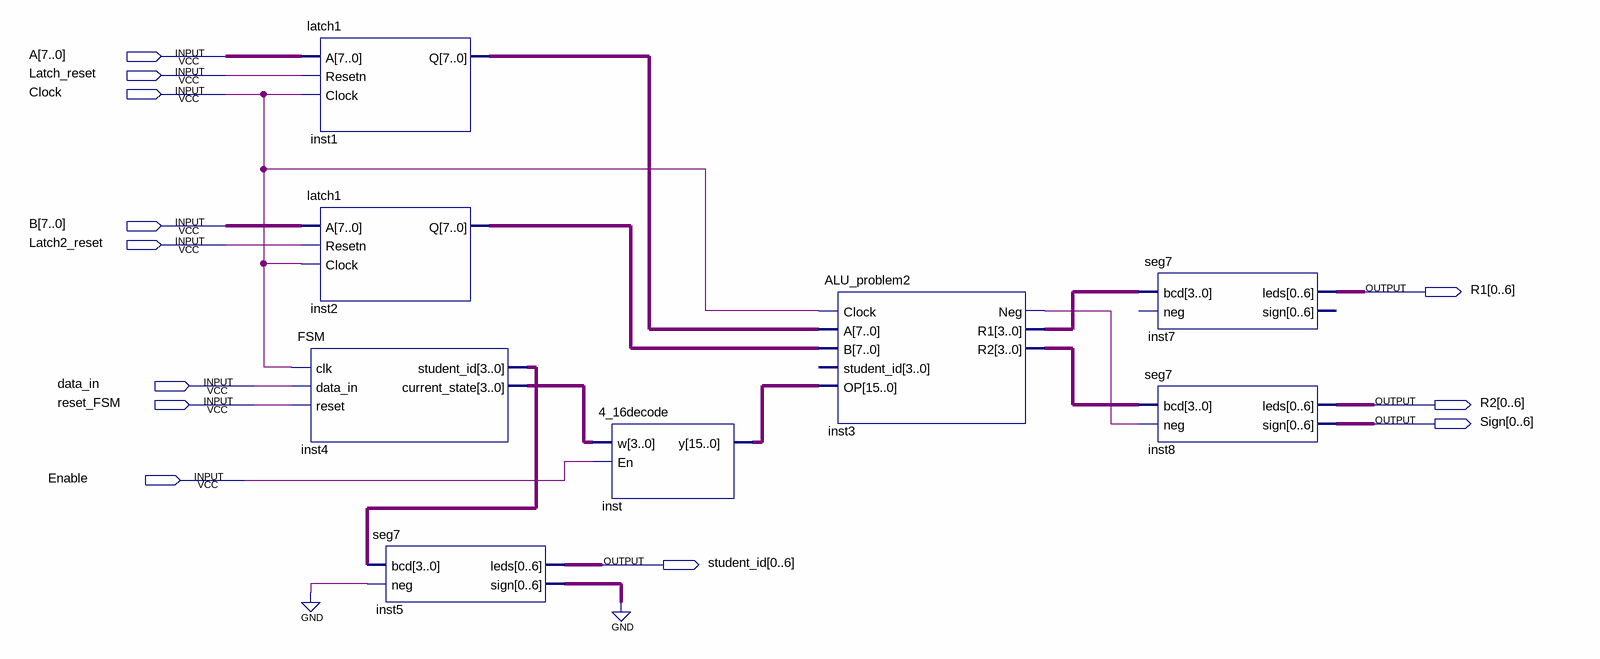
[diagram p0: schematic sheet]
// Quartus schematic problem2.bdf as structural Verilog: 8 symbols, 12 pins
module problem2 (
  input  [7:0] A,
  input  Latch_reset,
  input  Clock,
  input  [7:0] B,
  input  Latch2_reset,
  input  data_in,
  input  reset_FSM,
  input  Enable,
  output [0:6] R1,
  output [0:6] R2,
  output [0:6] Sign,
  output [0:6] student_id
);

  wire inst3_neg;
  wire [3:0] inst3_r1, inst3_r2, inst4_current_state, inst4_student_id;
  wire [6:0] inst5_sign;
  wire [7:0] inst1_q, inst2_q;
  wire [15:0] inst_y;

  latch1 inst1 (.A(A), .Resetn(Latch_reset), .Clock(Clock), .Q(inst1_q));
  latch1 inst2 (.A(B), .Resetn(Latch2_reset), .Clock(Clock), .Q(inst2_q));
  FSM inst4 (
    .clk(Clock), .data_in(data_in), .reset(reset_FSM), .student_id(inst4_student_id),
    .current_state(inst4_current_state));
  seg7 inst5 (.bcd(inst4_student_id), .neg(1'b0), .leds(student_id), .sign(inst5_sign));
  \4_16decode  inst (.w(inst4_current_state), .En(Enable), .y(inst_y));
  ALU_problem2 inst3 (
    .Clock(Clock), .A(inst1_q), .B(inst2_q), .OP(inst_y), .Neg(inst3_neg), .R1(inst3_r1), .R2(inst3_r2));  // open: student_id
  seg7 inst7 (.bcd(inst3_r1), .leds(R1));  // open: neg, sign
  seg7 inst8 (.bcd(inst3_r2), .neg(inst3_neg), .leds(R2), .sign(Sign));
  // also tied to GND on the sheet: {inst5_sign[0], inst5_sign[1], inst5_sign[2], inst5_sign[3], inst5_sign[4], inst5_sign[5], inst5_sign[6]}
endmodule
